# Altium schematic sheet Top-Sheet.SchDoc
size A4; SheetNumber: 1; SheetTotal: 4
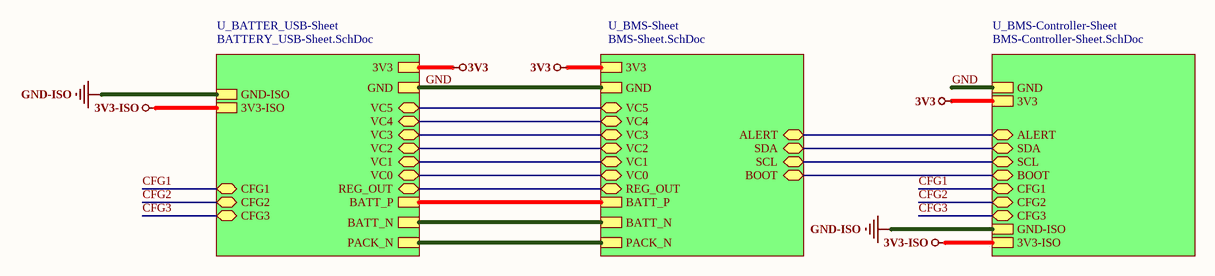
[diagram p0: Top-Sheet.SchDoc]

## Sub-sheets
U_BATTER_USB-Sheet = BATTERY_USB-Sheet.SchDoc: BATT_P, VC0 (bidir), BATT_N, VC1 (bidir), VC2 (bidir), VC3 (bidir), VC4 (bidir), VC5 (bidir), PACK_N, GND, GND-ISO, 3V3-ISO, REG_OUT (bidir), 3V3, CFG1 (bidir), CFG2 (bidir), CFG3 (bidir)
U_BMS-Controller-Sheet = BMS-Controller-Sheet.SchDoc: GND, 3V3, ALERT (bidir), SDA (bidir), SCL (bidir), BOOT (bidir), GND-ISO, 3V3-ISO, CFG1 (bidir), CFG2 (bidir), CFG3 (bidir)
U_BMS-Sheet = BMS-Sheet.SchDoc: ALERT (bidir), BOOT (bidir), SDA (bidir), SCL (bidir), VC0 (bidir), VC1 (bidir), VC2 (bidir), VC3 (bidir), VC4 (bidir), VC5 (bidir), BATT_P, BATT_N, PACK_N, GND, REG_OUT (bidir), 3V3

## Nets
3V3: sheet U_BMS-Sheet/3V3, sheet U_BMS-Controller-Sheet/3V3, sheet U_BATTER_USB-Sheet/3V3
3V3-ISO: sheet U_BMS-Controller-Sheet/3V3-ISO, sheet U_BATTER_USB-Sheet/3V3-ISO
GND-ISO: sheet U_BMS-Controller-Sheet/GND-ISO, sheet U_BATTER_USB-Sheet/GND-ISO
CFG1: sheet U_BMS-Controller-Sheet/CFG1, sheet U_BATTER_USB-Sheet/CFG1
CFG2: sheet U_BMS-Controller-Sheet/CFG2, sheet U_BATTER_USB-Sheet/CFG2
CFG3: sheet U_BMS-Controller-Sheet/CFG3, sheet U_BATTER_USB-Sheet/CFG3
GND: sheet U_BMS-Sheet/GND, sheet U_BMS-Controller-Sheet/GND, sheet U_BATTER_USB-Sheet/GND
(unnamed): sheet U_BMS-Sheet/ALERT, sheet U_BMS-Controller-Sheet/ALERT
(unnamed): sheet U_BMS-Sheet/BOOT, sheet U_BMS-Controller-Sheet/BOOT
(unnamed): sheet U_BMS-Sheet/SDA, sheet U_BMS-Controller-Sheet/SDA
(unnamed): sheet U_BMS-Sheet/SCL, sheet U_BMS-Controller-Sheet/SCL
(unnamed): sheet U_BMS-Sheet/VC0, sheet U_BATTER_USB-Sheet/VC0
(unnamed): sheet U_BMS-Sheet/VC1, sheet U_BATTER_USB-Sheet/VC1
(unnamed): sheet U_BMS-Sheet/VC2, sheet U_BATTER_USB-Sheet/VC2
(unnamed): sheet U_BMS-Sheet/VC3, sheet U_BATTER_USB-Sheet/VC3
(unnamed): sheet U_BMS-Sheet/VC4, sheet U_BATTER_USB-Sheet/VC4
(unnamed): sheet U_BMS-Sheet/VC5, sheet U_BATTER_USB-Sheet/VC5
(unnamed): sheet U_BMS-Sheet/BATT_P, sheet U_BATTER_USB-Sheet/BATT_P
(unnamed): sheet U_BMS-Sheet/BATT_N, sheet U_BATTER_USB-Sheet/BATT_N
(unnamed): sheet U_BMS-Sheet/PACK_N, sheet U_BATTER_USB-Sheet/PACK_N
(unnamed): sheet U_BMS-Sheet/REG_OUT, sheet U_BATTER_USB-Sheet/REG_OUT

## Notes on the sheet
- File:
- Title:
- Date:
- Page
- Num:
- Total:
- Drawn By: Huzaifa Ali